# Altium schematic sheet FieldSensor.SchDoc
size A3; SheetNumber: 1; SheetTotal: 1
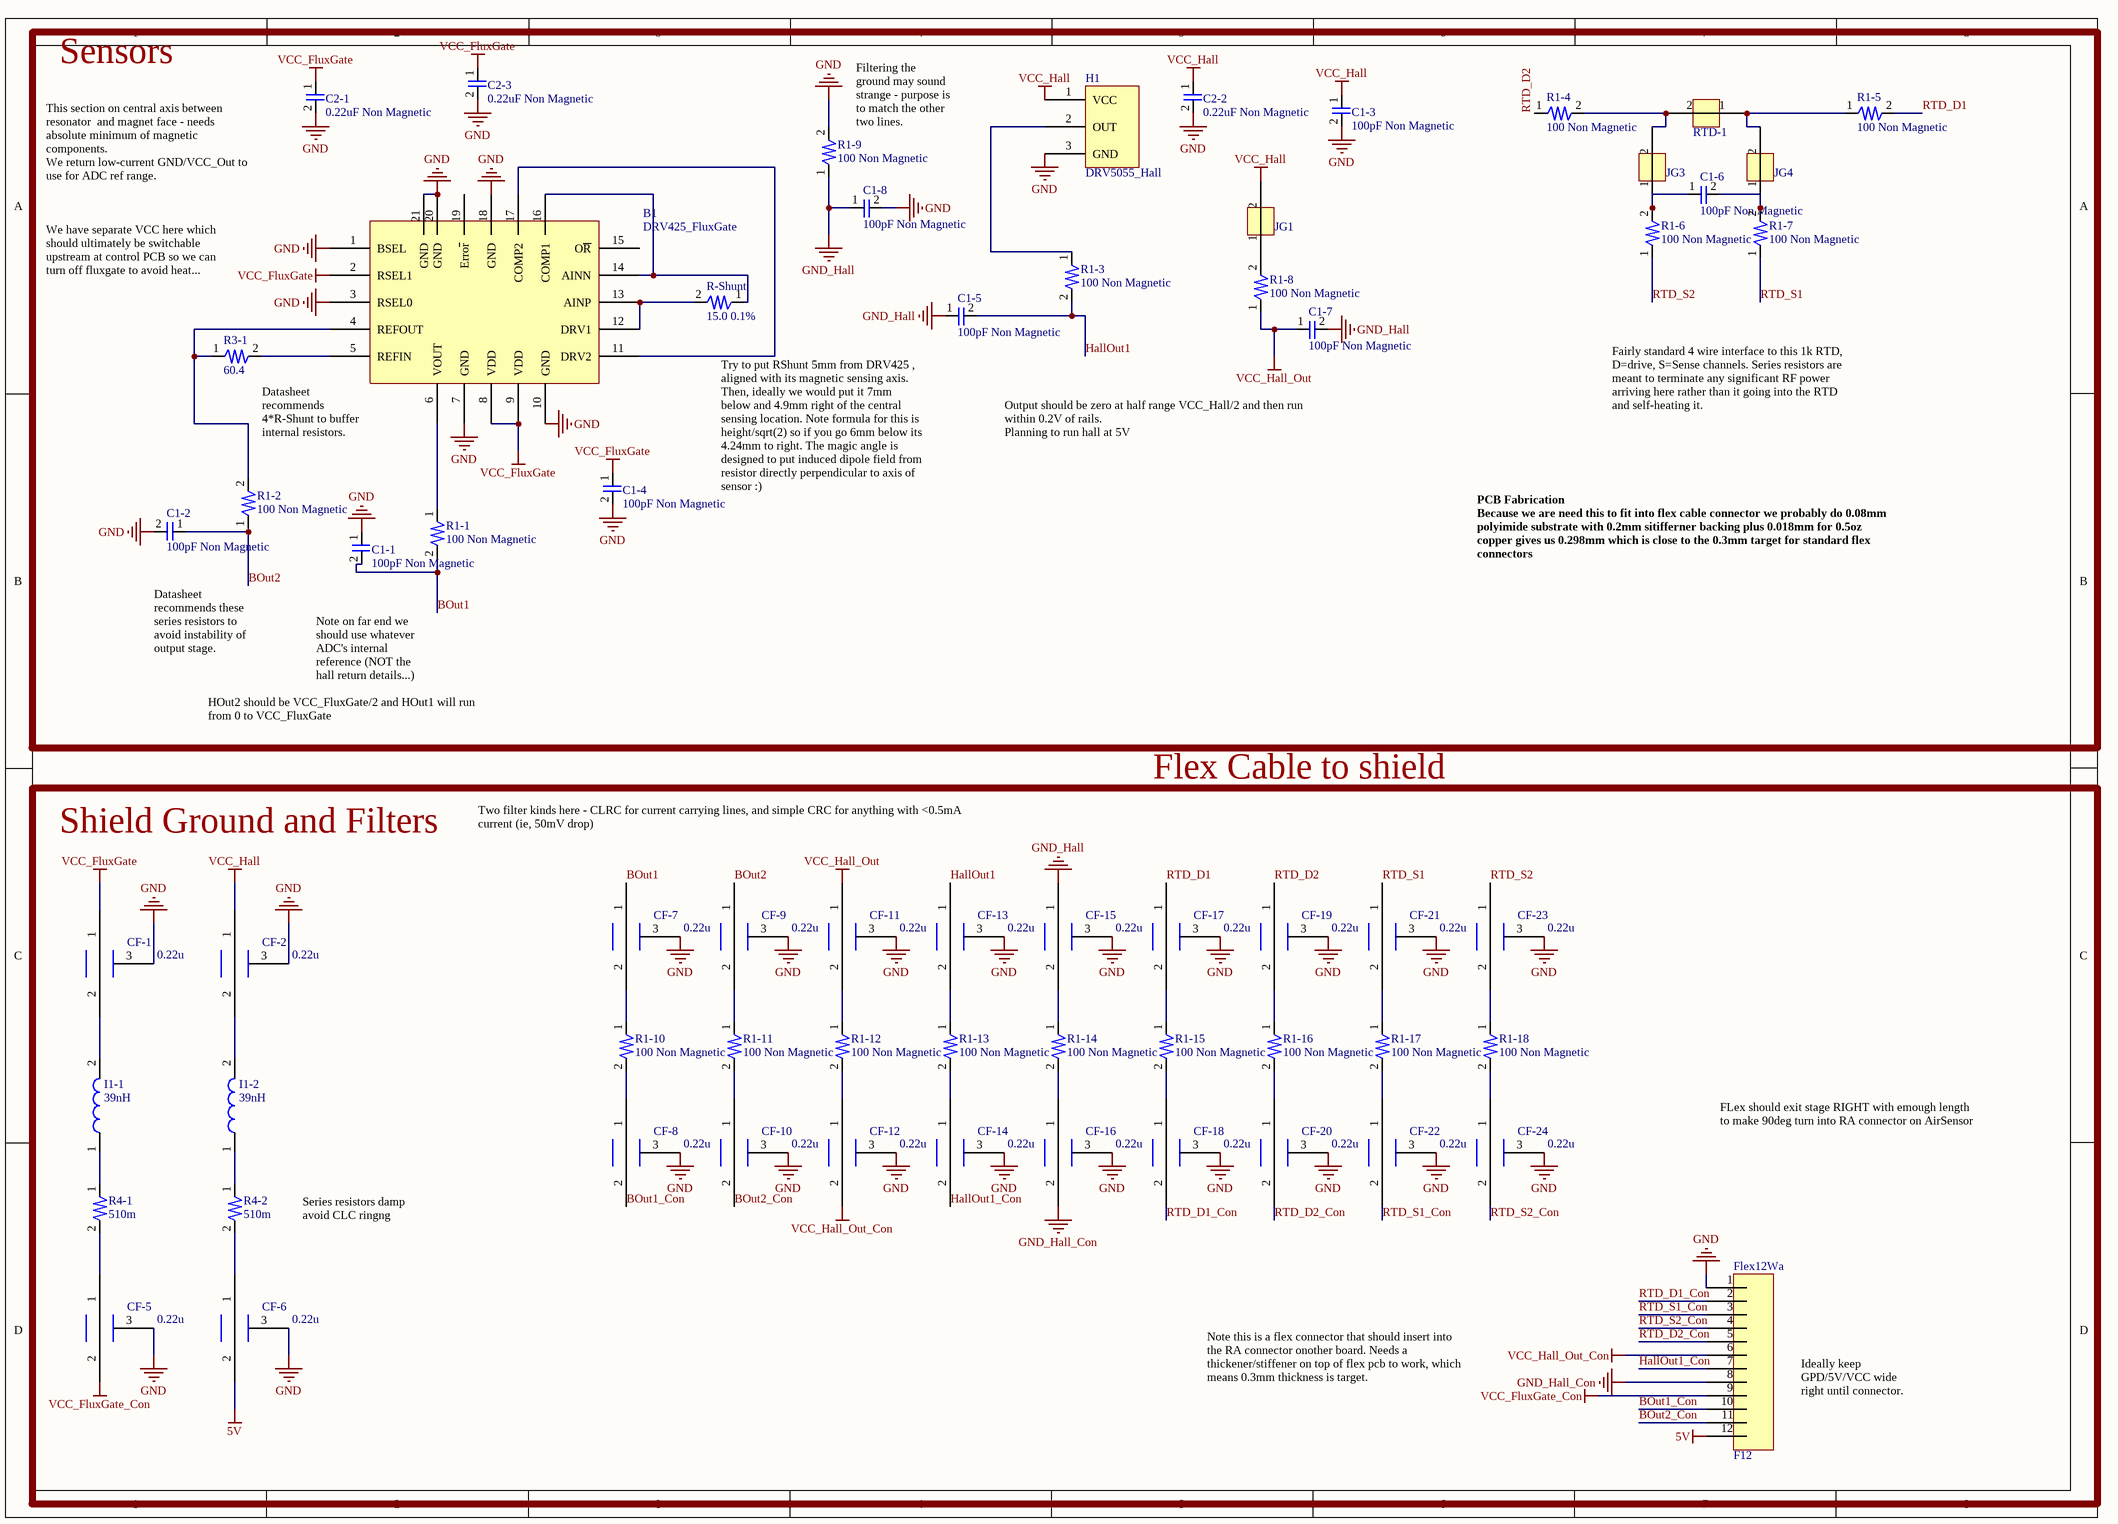
[diagram p0: FieldSensor.SchDoc]

## Parts
B1  DRV425_FluxGate  [20-WQFN]
C1-1  100pF Non Magnetic  [0402]
C1-2  100pF Non Magnetic  [0402]
C1-3  100pF Non Magnetic  [0402]
C1-4  100pF Non Magnetic  [0402]
C1-5  100pF Non Magnetic  [0402]
C1-6  100pF Non Magnetic  [0402]
C1-7  100pF Non Magnetic  [0402]
C1-8  100pF Non Magnetic  [0402]
C2-1  0.22uF Non Magnetic  [0805_Compact]
C2-2  0.22uF Non Magnetic  [0805_Compact]
C2-3  0.22uF Non Magnetic  [0805_Compact]
CF-1  0.22u  [0402-Passthrough]
CF-2  0.22u  [0402-Passthrough]
CF-5  0.22u  [0402-Passthrough]
CF-6  0.22u  [0402-Passthrough]
CF-7  0.22u  [0402-Passthrough]
CF-8  0.22u  [0402-Passthrough]
CF-9  0.22u  [0402-Passthrough]
CF-10  0.22u  [0402-Passthrough]
CF-11  0.22u  [0402-Passthrough]
CF-12  0.22u  [0402-Passthrough]
CF-13  0.22u  [0402-Passthrough]
CF-14  0.22u  [0402-Passthrough]
CF-15  0.22u  [0402-Passthrough]
CF-16  0.22u  [0402-Passthrough]
CF-17  0.22u  [0402-Passthrough]
CF-18  0.22u  [0402-Passthrough]
CF-19  0.22u  [0402-Passthrough]
CF-20  0.22u  [0402-Passthrough]
CF-21  0.22u  [0402-Passthrough]
CF-22  0.22u  [0402-Passthrough]
CF-23  0.22u  [0402-Passthrough]
CF-24  0.22u  [0402-Passthrough]
Flex12Wa  F12  [FLex12Way]
H1  DRV5055_Hall  [SOT23-3]
I1-1  39nH  [0603]
I1-2  39nH  [0603]
JG1  Jumper_Ground_Tiny  [GndConnectorTiny]  (value not drawn)
JG3  Jumper_Ground_Tiny  [GndConnectorTiny]  (value not drawn)
JG4  Jumper_Ground_Tiny  [GndConnectorTiny]  (value not drawn)
R1-1  100 Non Magnetic  [0402]
R1-2  100 Non Magnetic  [0402]
R1-3  100 Non Magnetic  [0402]
R1-4  100 Non Magnetic  [0402]
R1-5  100 Non Magnetic  [0402]
R1-6  100 Non Magnetic  [0402]
R1-7  100 Non Magnetic  [0402]
R1-8  100 Non Magnetic  [0402]
R1-9  100 Non Magnetic  [0402]
R1-10  100 Non Magnetic  [0402]
R1-11  100 Non Magnetic  [0402]
R1-12  100 Non Magnetic  [0402]
R1-13  100 Non Magnetic  [0402]
R1-14  100 Non Magnetic  [0402]
R1-15  100 Non Magnetic  [0402]
R1-16  100 Non Magnetic  [0402]
R1-17  100 Non Magnetic  [0402]
R1-18  100 Non Magnetic  [0402]
R3-1  60.4  [0402]
R4-1  510m  [0402]
R4-2  510m  [0402]
R-Shunt  15.0 0.1%  [0402]
RTD-1  RTD_SMD  [0603]  (value not drawn)

## Blocks framed on the sheet
Sensors: B1 C1-1-C1-8 C2-1-C2-3 H1 JG1 JG3 JG4 R1-1-R1-9 R3-1 R-Shunt RTD-1

## Nets
5V: CF-6.2 Flex12Wa.12
GND: B1.1(BSEL) B1.3(RSEL0) B1.7(GND) B1.10(GND) B1.18(GND) B1.20(GND) B1.21(GND) C1-1.1 C1-2.2 C1-3.2 C1-4.2 C1-8.2 C2-1.2 C2-2.2 C2-3.2 CF-1.3 CF-2.3 CF-5.3 CF-6.3 CF-7.3 CF-8.3 CF-9.3 CF-10.3 CF-11.3 CF-12.3 CF-13.3 CF-14.3 CF-15.3 CF-16.3 CF-17.3 CF-18.3 CF-19.3 CF-20.3 CF-21.3 CF-22.3 CF-23.3 CF-24.3 Flex12Wa.1 H1.3(GND) R1-9.2
GND_Hall: C1-5.1 C1-7.2 C1-8.1 CF-15.1 R1-9.1
GND_Hall_Con: CF-16.2 Flex12Wa.8
VCC_FluxGate: B1.2(RSEL1) B1.8(VDD) B1.9(VDD) C1-4.1 C2-1.1 C2-3.1 CF-1.1
VCC_FluxGate_Con: CF-5.2 Flex12Wa.9
VCC_Hall: C1-3.1 C2-2.1 CF-2.1 H1.1(VCC) JG1.2
VCC_Hall_Out: C1-7.1 CF-11.1 R1-8.1
VCC_Hall_Out_Con: CF-12.2 Flex12Wa.6
BOut1: C1-1.2 CF-7.1 R1-1.2
BOut1_Con: CF-8.2 Flex12Wa.10
BOut2: C1-2.1 CF-9.1 R1-2.1
BOut2_Con: CF-10.2 Flex12Wa.11
HallOut1: C1-5.2 CF-13.1 R1-3.2
HallOut1_Con: CF-14.2 Flex12Wa.7
RTD_D1: CF-17.1 R1-5.2
RTD_D1_Con: CF-18.2 Flex12Wa.2
RTD_D2: CF-19.1 R1-4.1
RTD_D2_Con: CF-20.2 Flex12Wa.5
RTD_S1: CF-21.1 R1-7.1
RTD_S1_Con: CF-22.2 Flex12Wa.3
RTD_S2: CF-23.1 R1-6.1
RTD_S2_Con: CF-24.2 Flex12Wa.4
NetB1_4: B1.4(REFOUT) R1-2.2 R3-1.1
NetB1_5: B1.5(REFIN) R3-1.2
NetB1_6: B1.6(VOUT) R1-1.1
NetB1_11: B1.11(DRV2) B1.17(COMP2)
NetB1_12: B1.12(DRV1) B1.13(AINP) R-Shunt.2
NetB1_14: B1.14(AINN) B1.16(COMP1) R-Shunt.1
NetC1-6_1: C1-6.1 JG3.1 R1-6.2
NetC1-6_2: C1-6.2 JG4.1 R1-7.2
NetCF-1_2: CF-1.2 I1-1.2
NetCF-2_2: CF-2.2 I1-2.2
NetCF-5_1: CF-5.1 R4-1.2
NetCF-6_1: CF-6.1 R4-2.2
NetCF-7_2: CF-7.2 R1-10.1
NetCF-8_1: CF-8.1 R1-10.2
NetCF-9_2: CF-9.2 R1-11.1
NetCF-10_1: CF-10.1 R1-11.2
NetCF-11_2: CF-11.2 R1-12.1
NetCF-12_1: CF-12.1 R1-12.2
NetCF-13_2: CF-13.2 R1-13.1
NetCF-14_1: CF-14.1 R1-13.2
NetCF-15_2: CF-15.2 R1-14.1
NetCF-16_1: CF-16.1 R1-14.2
NetCF-17_2: CF-17.2 R1-15.1
NetCF-18_1: CF-18.1 R1-15.2
NetCF-19_2: CF-19.2 R1-16.1
NetCF-20_1: CF-20.1 R1-16.2
NetCF-21_2: CF-21.2 R1-17.1
NetCF-22_1: CF-22.1 R1-17.2
NetCF-23_2: CF-23.2 R1-18.1
NetCF-24_1: CF-24.1 R1-18.2
NetH1_2: H1.2(OUT) R1-3.1
NetI1-1_1: I1-1.1 R4-1.1
NetI1-2_1: I1-2.1 R4-2.1
NetJG1_1: JG1.1 R1-8.2
NetJG3_2: JG3.2 R1-4.2 RTD-1.2
NetJG4_2: JG4.2 R1-5.1 RTD-1.1

Not connected (* = marked no-connect by the designer): B1 15(O~{R}) 19(Erro~{r})

## Notes on the sheet
- (near R1-9) Filtering the ground may sound strange - purpose is to match the other two lines.
- This section on central axis between resonator  and magnet face - needs absolute minimum of magnetic components.
  We return low-current GND/VCC_Out to use for ADC ref range.
- We have separate VCC here which should ultimately be switchable upstream at control PCB so we can turn off fluxgate to avoid heat...
- (near B1) Datasheet recommends 4*R-Shunt to buffer internal resistors.
- Fairly standard 4 wire interface to this 1k RTD, D=drive, S=Sense channels. Series resistors are meant to terminate any significant RF power arriving here rather than it going into the RTD and self-heating it.
- Try to put RShunt 5mm from DRV425 , aligned with its magnetic sensing axis. Then, ideally we would put it 7mm below and 4.9mm right of the central sensing location. Note formula for this is height/sqrt(2) so if you go 6mm below its 4.24mm to right. The magic angle is designed to put induced dipole field from resistor directly perpendicular to axis of sensor :)
- Output should be zero at half range VCC_Hall/2 and then run within 0.2V of rails.
  Planning to run hall at 5V
- Datasheet recommends these series resistors to avoid instability of output stage.
- HOut2 should be VCC_FluxGate/2 and HOut1 will run from 0 to VCC_FluxGate
- Note on far end we should use whatever ADC's internal reference (NOT the hall return details...)
- PCB Fabrication
  Because we are need this to fit into flex cable connector we probably do 0.08mm polyimide substrate with 0.2mm sitifferner backing plus 0.018mm for 0.5oz copper gives us 0.298mm which is close to the 0.3mm target for standard flex connectors
- Flex Cable to shield
- Shield Ground and Filters
- Two filter kinds here - CLRC for current carrying lines, and simple CRC for anything with <0.5mA current (ie, 50mV drop)
- FLex should exit stage RIGHT with emough length to make 90deg turn into RA connector on AirSensor
- Series resistors damp avoid CLC ringng
- Note this is a flex connector that should insert into the RA connector onother board. Needs a thickener/stiffener on top of flex pcb to work, which means 0.3mm thickness is target.
- Ideally keep GPD/5V/VCC wide right until connector.

## Library data of the parts
C1-1-C1-8 C2-1-C2-3 = Capacitor1
  C1-1-C1-8: Digikey P/N: 1608-1288-1-ND
  C2-1-C2-3: Digikey P/N: 1608-1296-1-ND
CF-1 CF-2 CF-5-CF-24 = CapFeedthrough: Digikey P/N: 445-YFF15AC1V224MT0Y0NCT-ND
I1-1 I1-2 = Inductor0603: Digikey P/N: 490-15822-1-ND
R1-1-R1-18 R3-1 R4-1 R4-2 R-Shunt = Res1
  R1-1-R1-18: Digikey P/N: 541-1899-1-ND
  R3-1: Digikey P/N: A139440CT-ND
  R4-1 R4-2: Digikey P/N: 541-4385-1-ND
  R-Shunt: Digikey P/N: A102634CT-ND
B1 = DRV425_FluxGate: Digikey P/N: 296-DRV425QWRTJRQ1CT-ND
H1 = DRV5055_Hall: Digikey P/N: 296-DRV5055Z3QDBZRCT-ND
RTD-1 = RTD_SMD: Digikey P/N: 2952-P1K0.0603.3FC.B-ND